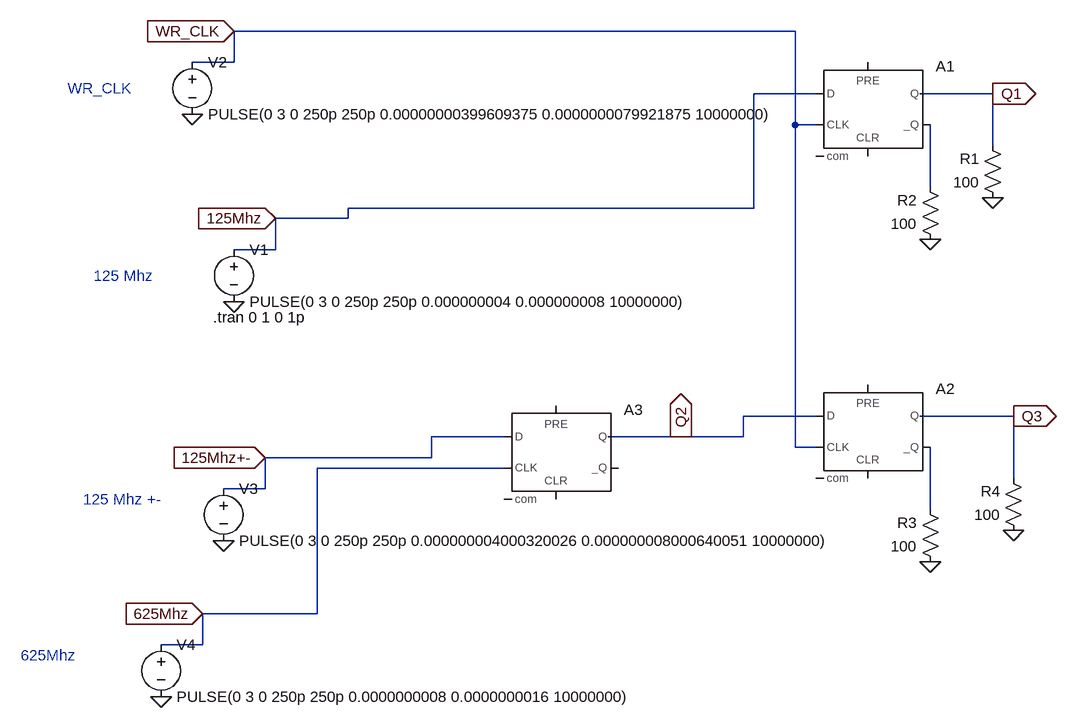
[diagram p0: schematic Symulacja_zegarów625Mhz.asc]
Symulacja_zegarów625Mhz.asc, the LTspice schematic file:
Version 4
SHEET 1 1228 680
WIRE 800 -416 -64 -416
WIRE -64 -368 -64 -416
WIRE -64 -368 -128 -368
WIRE 832 -320 736 -320
WIRE 1104 -320 992 -320
WIRE 800 -272 800 -416
WIRE 832 -272 800 -272
WIRE 1104 -240 1104 -320
WIRE 1008 -176 1008 -272
WIRE 736 -144 736 -320
WIRE 736 -144 112 -144
WIRE 112 -128 112 -144
WIRE 112 -128 0 -128
WIRE 0 -80 0 -128
WIRE 0 -80 -64 -80
WIRE 832 176 720 176
WIRE 1136 176 992 176
WIRE 352 208 240 208
WIRE 624 208 512 208
WIRE 720 208 720 176
WIRE 720 208 624 208
WIRE 800 224 800 -272
WIRE 832 224 800 224
WIRE 240 240 240 208
WIRE 240 240 -16 240
WIRE 352 256 64 256
WIRE 1136 272 1136 176
WIRE -16 288 -16 240
WIRE -16 288 -80 288
WIRE 1008 320 1008 224
WIRE 64 480 64 256
WIRE 64 480 -112 480
WIRE -112 528 -112 480
WIRE -112 528 -176 528
FLAG -64 0 0
FLAG -128 -288 0
FLAG 1008 -96 0
FLAG 1104 -160 0
FLAG -80 368 0
FLAG 1008 400 0
FLAG 1136 352 0
FLAG 1104 -320 Q1
IOPIN 1104 -320 Out
FLAG 1136 176 Q3
IOPIN 1136 176 Out
FLAG -64 -416 WR_CLK
IOPIN -64 -416 In
FLAG 0 -128 125Mhz
IOPIN 0 -128 In
FLAG -16 240 125Mhz+-
IOPIN -16 240 In
FLAG -176 608 0
FLAG -112 480 625Mhz
IOPIN -112 480 In
FLAG 624 208 Q2
IOPIN 624 208 Out
SYMBOL voltage -64 -96 R0
WINDOW 123 0 0 Left 0
WINDOW 39 0 0 Left 0
SYMATTR InstName V1
SYMATTR Value PULSE(0 3 0 250p 250p 0.000000004 0.000000008 10000000)
SYMBOL voltage -128 -384 R0
WINDOW 123 0 0 Left 0
WINDOW 39 0 0 Left 0
SYMATTR InstName V2
SYMATTR Value PULSE(0 3 0 250p 250p 0.00000000399609375 0.0000000079921875 10000000)
SYMBOL res 1120 -144 R180
WINDOW 0 36 76 Left 2
WINDOW 3 36 40 Left 2
SYMATTR InstName R1
SYMATTR Value 100
SYMBOL res 1024 -80 R180
WINDOW 0 36 76 Left 2
WINDOW 3 36 40 Left 2
SYMATTR InstName R2
SYMATTR Value 100
SYMBOL Digital\\dflop 912 -368 R0
SYMATTR InstName A1
SYMBOL voltage -80 272 R0
WINDOW 123 0 0 Left 0
WINDOW 39 0 0 Left 0
SYMATTR InstName V3
SYMATTR Value PULSE(0 3 0 250p 250p 0.000000004000320026 0.000000008000640051 10000000)
SYMBOL Digital\\dflop 912 128 R0
SYMATTR InstName A2
SYMBOL res 1024 416 R180
WINDOW 0 36 76 Left 2
WINDOW 3 36 40 Left 2
SYMATTR InstName R3
SYMATTR Value 100
SYMBOL res 1152 368 R180
WINDOW 0 36 76 Left 2
WINDOW 3 36 40 Left 2
SYMATTR InstName R4
SYMATTR Value 100
SYMBOL Digital\\dflop 432 160 R0
SYMATTR InstName A3
SYMBOL voltage -176 512 R0
WINDOW 123 0 0 Left 0
WINDOW 39 0 0 Left 0
SYMATTR InstName V4
SYMATTR Value PULSE(0 3 0 250p 250p 0.0000000008 0.0000000016 10000000)
TEXT -96 24 Left 2 !.tran 0 1 0 1p
TEXT -320 -328 Left 2 ;WR_CLK
TEXT -280 -40 Left 2 ;125 Mhz
TEXT -296 304 Left 2 ;125 Mhz +-
TEXT -392 544 Left 2 ;625Mhz

The netlist it stands for:
* Symulacja_zegarów625Mhz.asc
V1 125Mhz 0 PULSE(0 3 0 250p 250p 0.000000004 0.000000008 10000000)
V2 WR_CLK 0 PULSE(0 3 0 250p 250p 0.00000000399609375 0.0000000079921875 10000000)
R1 0 Q1 100
R2 0 N001 100
A1 125Mhz 0 WR_CLK 0 0 N001 Q1 0 DFLOP
V3 125Mhz+- 0 PULSE(0 3 0 250p 250p 0.000000004000320026 0.000000008000640051 10000000)
A2 Q2 0 WR_CLK 0 0 N002 Q3 0 DFLOP
R3 0 N002 100
R4 0 Q3 100
A3 125Mhz+- 0 625Mhz 0 0 0 Q2 0 DFLOP
V4 625Mhz 0 PULSE(0 3 0 250p 250p 0.0000000008 0.0000000016 10000000)
.tran 0 1 0 1p
* WR_CLK
* 125 Mhz
* 125 Mhz +-
* 625Mhz
.backanno
.end